# Altium schematic sheet ESP_TAS5825M.SchDoc
size 300 x 250 mm; SheetNumber: 1; SheetTotal: 1
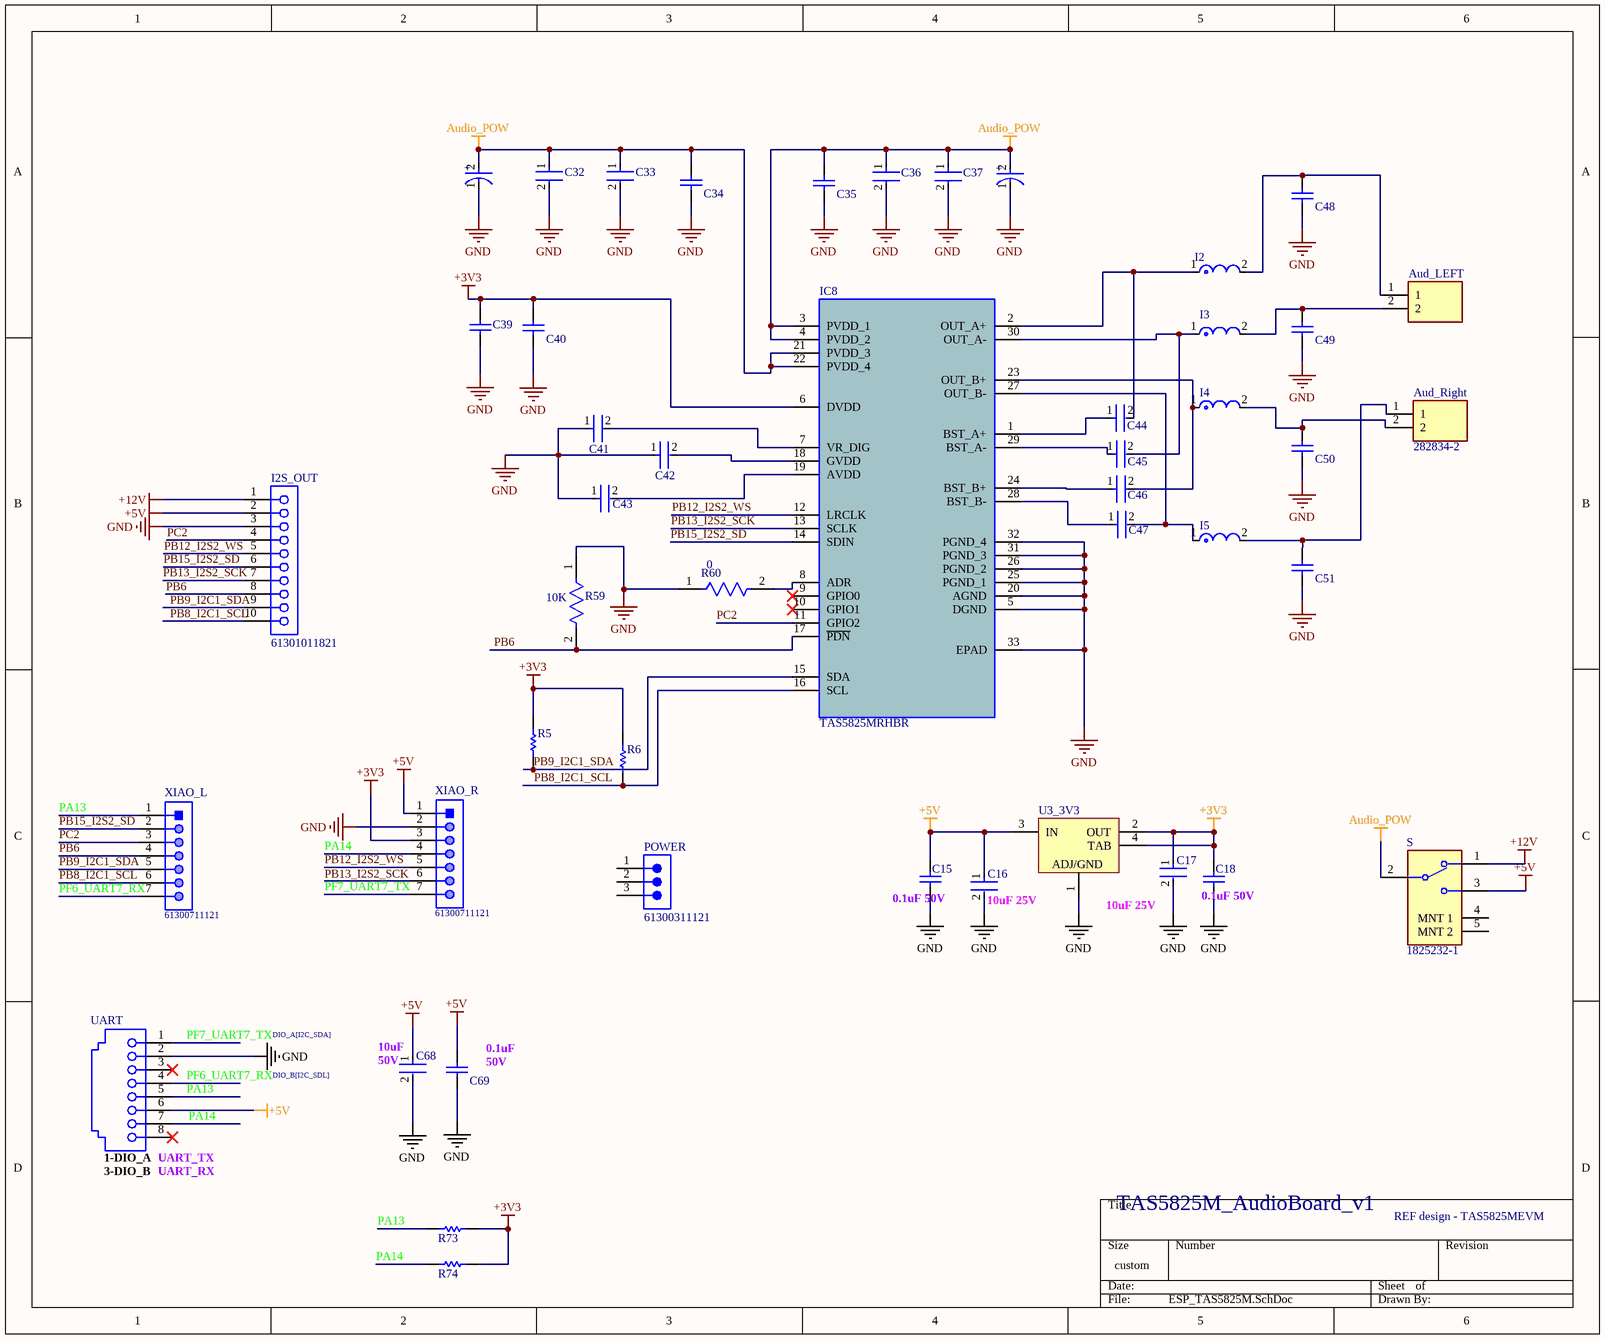
[diagram p0: ESP_TAS5825M.SchDoc]

## Parts
Aud_LEFT  282834-2  [282834-2_1]  (value not drawn)
Aud_Right  282834-2  [282834-2_1]
C15  GRM188R71H104KA93D  [CAPC1608X90X35ML10T15]  (value not drawn)
C16  CC1206KKX5R8BB105  [FP-CC1206-1_25-MFG]  (value not drawn)
C17  CC1206KKX5R8BB105  [FP-CC1206-1_25-MFG]  (value not drawn)
C18  GRM188R71H104KA93D  [CAPC1608X90X35ML10T15]  (value not drawn)
C31  25SVPF47M  [FP-OS-CON-SMT-C6-MFG]  (value not drawn)
C32  CL21A106KAYNNNE  [FP-CL21-IPC_A]  (value not drawn)
C33  CL21A106KAYNNNE  [FP-CL21-IPC_A]  (value not drawn)
C34  GRM188R71H104KA93D  [CAPC1608X90X35ML10T15]  (value not drawn)
C35  GRM188R71H104KA93D  [CAPC1608X90X35ML10T15]  (value not drawn)
C36  CL21A106KAYNNNE  [FP-CL21-IPC_A]  (value not drawn)
C37  CL21A106KAYNNNE  [FP-CL21-IPC_A]  (value not drawn)
C38  25SVPF47M  [FP-OS-CON-SMT-C6-MFG]  (value not drawn)
C39  C0603C475K8PACTU  [CAPC1608X87X35NL15T15]  (value not drawn)
C40  GRM188R71H104KA93D  [CAPC1608X90X35ML10T15]  (value not drawn)
C41  C0603C105K4PACTU  [FP-C0603C105K4PACTU-MFG]  (value not drawn)
C42  C0603C105K4PACTU  [FP-C0603C105K4PACTU-MFG]  (value not drawn)
C43  C0603C105K4PACTU  [FP-C0603C105K4PACTU-MFG]  (value not drawn)
C44  GCM188R71H224KA64D  [FP-GCM188-0_1-IPC_A]  (value not drawn)
C45  GCM188R71H224KA64D  [FP-GCM188-0_1-IPC_A]  (value not drawn)
C46  GCM188R71H224KA64D  [FP-GCM188-0_1-IPC_A]  (value not drawn)
C47  GCM188R71H224KA64D  [FP-GCM188-0_1-IPC_A]  (value not drawn)
C48  C0805C684K5RACTU  [CAPC2013X145X50ML20T25]  (value not drawn)
C49  C0805C684K5RACTU  [CAPC2013X145X50ML20T25]  (value not drawn)
C50  C0805C684K5RACTU  [CAPC2013X145X50ML20T25]  (value not drawn)
C51  C0805C684K5RACTU  [CAPC2013X145X50ML20T25]  (value not drawn)
C68  CC1206KKX5R8BB105  [FP-CC1206-1_25-MFG]  (value not drawn)
C69  GRM188R71H104KA93D  [CAPC1608X90X35ML10T15]  (value not drawn)
I2  1274AS-H-100M=P3  [FP-DEM10050C-MFG]  (value not drawn)
I2S_OUT  61301011821  [61301011821]
I3  1274AS-H-100M=P3  [FP-DEM10050C-MFG]  (value not drawn)
I4  1274AS-H-100M=P3  [FP-DEM10050C-MFG]  (value not drawn)
I5  1274AS-H-100M=P3  [FP-DEM10050C-MFG]  (value not drawn)
IC8  TAS5825MRHBR  [QFN50P500X500X100-33N-D]
POWER  61300311121  [61300311121]
R5  10K  [0603R]  (value not drawn)
R6  10K  [0603R]  (value not drawn)
R59  ERJ-2RKF1003X  [FP-ERJ2RK-IPC_C]  (value not drawn)
R60  ERJ-2RKF1003X  [FP-ERJ2RK-IPC_C]  (value not drawn)
R73  2K2  [0603R]  (value not drawn)
R74  2K2  [0603R]  (value not drawn)
S  1825232-1  [FP-1825232-1-MFG]
U3_3V3  NCP1117ST33T3G  [ONSC-SOT-223-4-318H-01_A_V]  (value not drawn)
UART  615008138021  [615008138021]  (value not drawn)
XIAO_L  61300711121  [61300711121]
XIAO_R  61300711121  [61300711121]

## Nets
+3V3: C17.1 C18.2 C39.2 C40.2 IC8.6(DVDD) R5.1 R6.1 R73.1 R74.1 U3_3V3.2(OUT) U3_3V3.4(TAB) XIAO_R.3
+5V: C15.2 C16.1 C68.1 C69.2 I2S_OUT.2 S.3 U3_3V3.3(IN) UART.6 XIAO_R.1
+12V: I2S_OUT.1 S.1
Audio_POW: C31.2(A) C32.1 C33.1 C34.2 C35.2 C36.1 C37.1 C38.2(A) IC8.3(PVDD_1) IC8.4(PVDD_2) IC8.21(PVDD_3) IC8.22(PVDD_4) S.2
GND: C15.1 C16.2 C17.2 C18.1 C31.1(C) C32.2 C33.2 C34.1 C35.1 C36.2 C37.2 C38.1(C) C39.1 C40.1 C41.1 C42.1 C43.1 C48.2 C49.1 C50.1 C51.1 C68.2 C69.1 I2S_OUT.3 IC8.5(DGND) IC8.20(AGND) IC8.25(PGND_1) IC8.26(PGND_2) IC8.31(PGND_3) IC8.32(PGND_4) IC8.33(EPAD) R59.1 R60.1 U3_3V3.1(ADJ/GND) UART.2 XIAO_R.2
PA13: R73.2 UART.5 XIAO_L.1
PA14: R74.2 UART.7 XIAO_R.4
PB6: I2S_OUT.8 IC8.17(~{PDN}) R59.2 XIAO_L.4
PB8_I2C1_SCL: I2S_OUT.10 IC8.16(SCL) R6.2 XIAO_L.6
PB9_I2C1_SDA: I2S_OUT.9 IC8.15(SDA) R5.2 XIAO_L.5
PB12_I2S2_WS: I2S_OUT.5 IC8.12(LRCLK) XIAO_R.5
PB13_I2S2_SCK: I2S_OUT.7 IC8.13(SCLK)
PB15_I2S2_SD: I2S_OUT.6 IC8.14(SDIN) XIAO_L.2
PC2: I2S_OUT.4 IC8.11(GPIO2) XIAO_L.3
PF6_UART7_RX: UART.4 XIAO_L.7
PF7_UART7_TX: UART.1 XIAO_R.7
NetAud_LEFT_1: Aud_LEFT.1 C48.1 I2.2
NetAud_LEFT_2: Aud_LEFT.2 C49.2 I3.2
NetAud_Right_1: Aud_Right.1 C51.2 I5.2
NetAud_Right_2: Aud_Right.2 C50.2 I4.2
NetC41_2: C41.2 IC8.7(VR_DIG)
NetC42_2: C42.2 IC8.18(GVDD)
NetC43_2: C43.2 IC8.19(AVDD)
NetC44_1: C44.1 IC8.1(BST_A+)
NetC44_2: C44.2 I2.1 IC8.2(OUT_A+)
NetC45_1: C45.1 IC8.29(BST_A-)
NetC45_2: C45.2 I3.1 IC8.30(OUT_A-)
NetC46_1: C46.1 IC8.24(BST_B+)
NetC46_2: C46.2 I4.1 IC8.23(OUT_B+)
NetC47_1: C47.1 IC8.28(BST_B-)
NetC47_2: C47.2 I5.1 IC8.27(OUT_B-)
NetIC8_8: IC8.8(ADR) R60.2

Not connected (* = marked no-connect by the designer): IC8 9(GPIO0)* 10(GPIO1)*; POWER 1 2 3; S 4(MNT_1) 5(MNT_2); UART 3* 8*; XIAO_R 6

## Notes on the sheet
- (near R59) 10K
- (near R60) 0
- (near C15) 0.1uF 50V
- (near C16) 10uF 25V
- 10uF 25V
- (near C18) 0.1uF 50V
- DIO_A[I2C_SDA]
- DIO_B[I2C_SDL]
- (near C68) 10uF 50V
- (near C69) 0.1uF 50V
- (near UART) 1-DIO_A
- (near UART) 3-DIO_B
- (near UART) UART_TX
- (near UART) UART_RX
- TAS5825M_AudioBoard_v1
- REF design - TAS5825MEVM
- Labels drawn without touching a wire or pin: PB13_I2S2_SCK
- (in symbol CMP-05427-000065-2) +

## Library data of the parts
Aud_LEFT Aud_Right = 282834-2: Connector; Manufacturer_Name: TE Connectivity; Datasheet Link: https://componentsearchengine.com//282834-2.pdf; Mouser2 Part Number: 571-282834-2; Mouser2 Price/Stock: https://www.mouser.com/Search/Refine.aspx?Keyword=571-282834-2; Manufacturer_Part_Number: 282834-2
C15 C18 C34 C35 C40 C69 = CMP-2100-03643-1: Chip Capacitor, 0.1 uF, +/- 10%, 50 V, -55 to 125 degC, 0603 (1608 Metric), RoHS, Tape and Reel (C77055); Manufacturer: Murata; Dielectric Material: Ceramic; Voltage Rating: 50V; Capacitance: 100nF; Dielectric: X7R; Insulation Resistance: 10GR; Case Code (Metric): 1608; Lead Free: LeadFree; Depth: 0.8mm; Number of Pins: 2; Radiation Hardening: No; Case/Package: 0603; Manufacturer URL: http://www.murata.com/; Packaging: TapeandReel; Length: 1.6mm; Contact Plating: Tin; Datasheet URL: http://psearch.en.murata.com/capacitor/product/GRM188R71H104KA93%23.pdf; Tolerance: 10%; Case Code (Imperial): 0603; Min Operating Temperature: -55degC; RoHSCompliant: true; Voltage: 50V; Termination: SMD/SMT; Mount: SurfaceMount; Material: Ceramic; Package Quantity: 1; Height: 0.8mm; Thickness: 0.035inch; REACH SVHC: NoSVHC; Max Operating Temperature: 125degC; Width: 0.8mm; Package Reference: 0603; Voltage Rating (DC): 50V; Datasheet Version: 42675.0; Package Description: 2-Pin Surface Mount Device, Body 1.6 x 0.8 mm
C16 C17 C68 = CMP-03422-001167-1: 10uF 25V X5R ±10% 1206 Multilayer Ceramic Capacitors MLCC - SMD/SMT ROHS (C128855); Manufacturer: Yageo; Temperature Coefficient: 15%; Value: 1 uF; Tolerance: 0.1; Automotive Grade: NA; Temperature: -55°C to +125°C; Footprint Url: http://www.yageo.com/exep/pages/download/literatures/UPY-C_GEN_24.pdf; Lead Free: Yes; Device Class L2: Capacitors; Temperature Range High: +125°C; Manufacturer Part Number: CC1206KKX5R8BB105; Voltage Rating: 25 V; ComponentLink2Description: Datasheet; Device Class L3: Ceramic Capacitors; RoHS: TRUE; Temperature Characteristic: X5R; Digikey Description: CAP CER 1UF 25V X5R 1206; Mouser Description: Multilayer Ceramic Capacitors MLCC - SMD/SMT 1.0uF 25V X5R 10%; Capacitance: 1 uF; Material: Ceramic; Height: 1.45mm; Automotive: No; Category: Cap; Octopart: https://octopart.com/cc1206kkx5r8bb105-yageo-20779154; ComponentLink2URL: http://www.yageo.com/documents/recent/UPY-NP0X7R_HV_1KV-to-3KV_11.pdf; Package: CC1206-1.25; Device Class L1: Passive Components; Temperature Range Low: -55°C
C31 C38 = CMP-05427-000065-2: Conductive Polymer Aluminum Solid Capacitors (OS-CON) 47uF ±20% 25V (C136280); Ripple Current: 2.8A; Polarity: Polar; Leakage Current: 235uA; Dissipation Factor: 12%; ESR (Equivalent Series Resistance): 30mR; Life (Hours): 5000Hour; Diameter: 6.3mm; Voltage: 25V; Package Quantity: 1000; Packaging: Tape and Reel; Height - Seated (Max): 0.236inch; Case/Package: Radial; Termination: SMD/SMT; Series: OS-CON™, SVPF; Number of Pins: 6; Capacitance: 47uF; Min Operating Temperature: -55°C; Mount: Surface Mount; RoHS Compliant: Yes; Voltage Rating (DC): 25V; Length: 5.9mm; REACH SVHC: No SVHC; Voltage Rating: 25V; Ripple Current (AC): 2.8A; Tolerance: 20%; Height: 5.9mm; Max Operating Temperature: 105°C
C32 C33 C36 C37 = CMP-13271-002975-1: CL21 Series 0805 10uF 25V ±10% Tolerance X5R Multilayer Ceramic Chip Capacitor (C15850); Case Code (Imperial): 0805; Length: 2mm; Case/Package: 0805; Packaging: Tape and Reel; Width: 0.049inch; Tolerance: 10%; Mount: Surface Mount; Min Operating Temperature: -55°C; Thickness: 0.057inch; Height: 1.25mm; Dielectric: X5R; Package Quantity: 1; Depth: 1.25mm; Capacitance: 10uF; Voltage Rating: 25V; Case Code (Metric): 2012; Max Operating Temperature: 85°C; Radiation Hardening: No
C39 = CMP-2006-03238-1: 10V 4.7uF X5R ±10% 0603 Multilayer Ceramic Capacitors MLCC - SMD/SMT ROHS (C6475754); Manufacturer: Kemet; Part Number: C0603C475K8PACTU
C41-C43 = CMP-2006-02279-2: CAP CER 1UF 16V X5R 0603 (C2181804); Tolerance: 10%; Dielectric Material: Ceramic; Dissipation Factor: 5%; Contact Plating: Tin; Width: 0.8mm; Case Code (Metric): 1608; Construction: Flat; Dielectric: X5R; Termination: SMD/SMT; Capacitance: 1uF; Package Quantity: 4000; Depth: 0.8mm; Min Operating Temperature: -55°C; Radiation Hardening: No; Voltage: 16V; Case Code (Imperial): 0603; Mount: Surface Mount; Max Operating Temperature: 85°C; Voltage Rating: 16V; Case/Package: 0603; Length: 1.6mm; Packaging: Tape and Reel; Height: 0.8mm; Voltage Rating (DC): 16V
C44-C47 = CMP-2006-02383-2: Ceramic Capacitor for Automotive 220nF  ±10% 50VDC X7R 0603 Paper T/R (C97857); Voltage Rating (DC): 50V; Capacitance: 220nF; Height: 0.8mm; Width: 0.031inch; Length: 1.6mm; Termination: SMD/SMT; Mount: Surface Mount; Depth: 0.8mm; REACH SVHC: No SVHC; Thickness: 0.035inch; Min Operating Temperature: -55°C; Case/Package: 0603; Max Operating Temperature: 125°C; Packaging: Tape and Reel; Dielectric: X7R; Package Quantity: 10; Voltage Rating: 50V; Tolerance: 10%; Ratings: AEC-Q200; Voltage: 50V; Lead Free: Lead Free; Radiation Hardening: No; Case Code (Metric): 1608; Case Code (Imperial): 0603
C48-C51 = CMP-1036-04712-2: 0805 Multilayer Ceramic Capacitors MLCC - SMD/SMT ROHS (C22402009); Manufacturer: Kemet; Part Number: C0805C684K5RACTU
I2-I5 = CMP-06042-000104-1: 10uH 45mΩ 6.2A 8.5A Molded Inductor ±20% SMD,8.5x8mm Power Inductors ROHS (C41413139); Test Frequency: 100kHz; Shielding: Shielded; DC Resistance (DCR): 30.4mR; Max DC Current: 4.4A; Core Material: Ferrite; Length: 0.394inch; Number of Pins: 2; Tolerance: 20%; Resistor Type: Wirewound; Case/Package: SMD/SMT; Inductance: 10uH; Width: 0.394inch; Packaging: Tape and Reel; Saturation Current: 6.2A; Mount: Surface Mount; Height - Seated (Max): 0.199inch; Current Rating: 4.4A
I2S_OUT = CMP-1502-01332-4: THT Vertical Socket Header WR-PHD, Pitch 2.54 mm, Single Row, 10 pins; Contact Resistance: 20mΩ; Connector Type: Header, Socket; Gender: Female; Number of Positions: 10; Pitch: 2.54mm; Operating Supply Voltage: 250V; Insulation Resistance: 1GΩ; Current Rating: 3A; Insulation: Insulated; Color: Black; Mount: Through Hole; Length: 25.9mm; Lead Free: Lead Free; Number of Rows: 1; Contact Gender: Female; Max Operating Temperature: 125°C; Voltage Rating: 250V; Number of Contacts: 10; Width: 25.9mm; Flammability Rating: UL94 V-0; Orientation: Vertical; Housing Material: PBT; Lead Pitch: 2.54mm; Number of Pins: 10; RoHS: Compliant; Contact Material: Copper; Termination: Through Hole; Contact Plating: Gold; Height: 8.5mm; Min Operating Temperature: -40°C
IC8 = TAS5825MRHBR: -25℃~+85℃ 0.03% 111dB 17.5mA 2-Channel 38Wx1@8Ω 4.5V~26.4V 72dB 90% Class D VQFN-32(5x5) Audio Amplifiers ROHS (C471049); Manufacturer_Name: Texas Instruments; Datasheet Link: http://www.ti.com/lit/gpn/tas5825m; Height: 1mm; Manufacturer_Part_Number: TAS5825MRHBR; Mouser Part Number: 595-TAS5825MRHBR; Mouser Price/Stock: https://www.mouser.co.uk/ProductDetail/Texas-Instruments/TAS5825MRHBR?qs=f9yNj16SXrKGX4MqJgnnYg%3D%3D; Arrow Part Number: TAS5825MRHBR; Arrow Price/Stock: https://www.arrow.com/en/products/tas5825mrhbr/texas-instruments?region=nac
POWER = CMP-1502-01062-4: THT Vertical Pin Header WR-PHD, Pitch 2.54 mm, Single Row, 3 pins; Connector Type: Male Pin; Number of Contacts: 3; Operating Supply Voltage: 250V; Current Rating: 3A; Pitch: 2.54mm; Contact Resistance: 20mΩ; Gender: Male; Height: 8.94mm; Color: Black; Min Operating Temperature: -40°C; Max Operating Temperature: 105°C; Mount: Through Hole; Termination: Solder; Number of Rows: 1; Packaging: Bulk; Number of Pins: 3; Lead Pitch: 2.54mm; RoHS: Compliant; Contact Plating: Gold; Number of Positions: 3; Lead Free: Lead Free; Voltage Rating: 250V; Contact Mating Length: 5.9944mm; Orientation: Vertical; Contact Material: Gold
R5 = Res_12K1_1%_0603: -55?~+155? 100mW 2.2kO 75V Thick Film Resistor ±1% ±100ppm/? 0603 Chip Resistor - Surface Mount ROHS (C125931); Manuf_Part_1: MCT 0603-50 1% P5 12K1; Manuf_1: VISHAY; Value: 12K1; Order: 2325243; ECCN_US/EU: n/a; Distrib: FARNELL
R6 = Res_12K1_1%_0603: -55℃~+155℃ 100mW 10kΩ 75V Thick Film Resistor ±1% ±100ppm/℃ 0603 Chip Resistor - Surface Mount ROHS (C99198); Manuf_Part_1: MCT 0603-50 1% P5 12K1; Manuf_1: VISHAY; Value: 12K1; Order: 2325243; ECCN_US/EU: n/a; Distrib: FARNELL
R59 R60 = CMP-2002-00608-4: RES SMD 100K OHM 1% 1/10W 0402 (C192169); Resistance: 100kR; Voltage Rating (DC): 50V; Power Rating: 100mW; Temperature Coefficient: 100ppm/°C; Case/Package: 0402; Length: 1mm; Package Quantity: 1; Radiation Hardening: No; Case Code (Metric): 1005; Contact Plating: Tin; Mount: Surface Mount; Depth: 0.5mm; Max Operating Temperature: 155°C; Lead Free: Lead Free; Width: 0.5mm; Composition: Thick Film; Case Code (Imperial): 0402; Tolerance: 1%; Termination: SMD/SMT; Number of Pins: 2; Height: 0.35mm; Voltage Rating: 50V; Military Standard: Not; REACH SVHC: No SVHC; Packaging: Tape and Reel; Min Operating Temperature: -55°C; Max Power Dissipation: 100mW; Features: Automotive AEC-Q200; Number of Terminations: 2
R73 R74 = Res_12K1_1%_0603: -55℃~+155℃ 100mW 2.2kΩ 75V Thick Film Resistor ±1% ±100ppm/℃ 0603 Chip Resistor - Surface Mount ROHS (C309562); Manuf_Part_1: MCT 0603-50 1% P5 12K1; Manuf_1: VISHAY; Value: 12K1; Order: 2325243; ECCN_US/EU: n/a; Distrib: FARNELL
S = CMP-03405-000001-1: SWITCH SLIDE SPDT 200MA 30V (C5167252); Manufacturer: TE Connectivity; Contact Current Rating: 0.2A; Contact Resistance: 20mΩ; Electromechanical Life: 10000Cycles; Operating Force: 200gf; Throw Configuration: SPDT; Manufacturer Part Number: 1825232-1; Temperature Range High: +70°C; Height: 3.7mm; ComponentLink2URL: https://www.te.com/commerce/DocumentDelivery/DDEController?Action=showdoc&DocId=Customer+Drawing%7F1825232%7FB2%7Fpdf%7FEnglish%7FENG_CD_1825232_B2.pdf%7F1825232-1; Mount: Through Hole; Mouser Description: Slide Switches SLIDE SWITCH SPDT Right Angle; Package: 1825232-1; Temperature: -20°C to +70°C; Automotive: No; ComponentLink2Description: Datasheet; Lead Free: Yes; Octopart: https://octopart.com/1825232-1-te+connectivity-45209882; Device Class L1: Electromechanical; Digikey Description: SWITCH SLIDE SPDT 200MA 30V; Device Class L3: Slide Switches; Device Class L2: Switches; Voltage Rating Dc: 30V; Temperature Range Low: -20°C; Category: Switch; RoHS: TRUE
U3_3V3 = CMP-1679-00010-1: Low-Dropout Positive Fixed Voltage Regulator, 1 A, 3.3 V Output Voltage, 0 to 125 degC, 4-Pin SOT-223 (318H-01), Pb-Free, Tape and Reel (C26537); Resistance: 220 kohm; Type (Resistor): Thick Film; Voltage Rating: 75 V; Tolerance: 1%; Case\Package: 0603; Power Rating: 100 mW; Width: 0.85 mm; Weight: 7.1E-05 oz; ComponentLink2URL: http://www.onsemi.com/pub_link/Collateral/NCP1117-D.PDF; RoHSCompliant: true; Height: 0.45 mm; PackageDescription: 4-Pin Small Outline Transistor, Body 6.5 x 3.5 mm, Pitch 2.3 mm; ComponentLink1Description: Manufacturer URL; ComponentLink1URL: http://www.onsemi.com/; PackageReference: SOT-223-4-318H-01_A; Max Operating Temperature: 155 degC; Packaging: Tape and Reel; REACH SVHC: Unknown; Length: 1.55 mm; Package Quantity: 5000; Radiation Hardening: No; Min Operating Temperature: -55 degC; DatasheetVersion: Rev. 27, 09/2014; Mount: Surface Mount; Case Code (Imperial): 0603; Case Code (Metric): 1608; ComponentLink2Description: Datasheet
UART = CMP-1502-01725-1: Modular Jack WR-MJ, Plastic, Vertical Entry, THT, 8P8C (C86492); Manufacturer: Wurth Elektronik; Withstanding Voltage: 1000VAC; Contact Resistance: 20mOhm; Port: 1x1; Working Voltage: 120VAC; Rated Current: 1.5A; Compliance: Leadfree/RoHS; Entrance: Vertical; Publisher: WurthElektronik; Datasheet URL: https://katalog.we-online.de/em/datasheet/615008138021.pdf; Part Number: 615008138021; Manufacturer URL: http://www.we-online.de; Pin Number: 8P8C; Mounting Technology: THT; Operating Temperature: -40to85degC; Package Reference: 615008138021; Packaging: Tray
XIAO_L XIAO_R = CMP-1502-01074-1: THT Vertical Pin Header WR-PHD, Pitch 2.54 mm, Single Row, 7 pins; Manufacturer: Wurth Elektronik; Pin Number: 7; Gender: Male; Working Voltage: 250VAC; Contact Resistance: 20mOhm; Rated Current: 3A; Pitch: 2.54mm; Withstanding Voltage: 500VAC; Row Number: Single; Packaging: Bag; Orientation: Vertical; Manufacturer URL: http://www.we-online.de; Datasheet URL: https://katalog.we-online.de/em/datasheet/6130xx11121.pdf; Part Number: 61300711121; Publisher: WurthElektronik; Operating Temperature: -40to105degC; Mounting Technology: THT; Package Reference: 61300711121